# Altium project a4403-ELE-CAD.PrjPcb (part 4 of 4)

## Sheet SMPS.SchDoc
size Letter; SheetNumber: 13; SheetTotal: 15
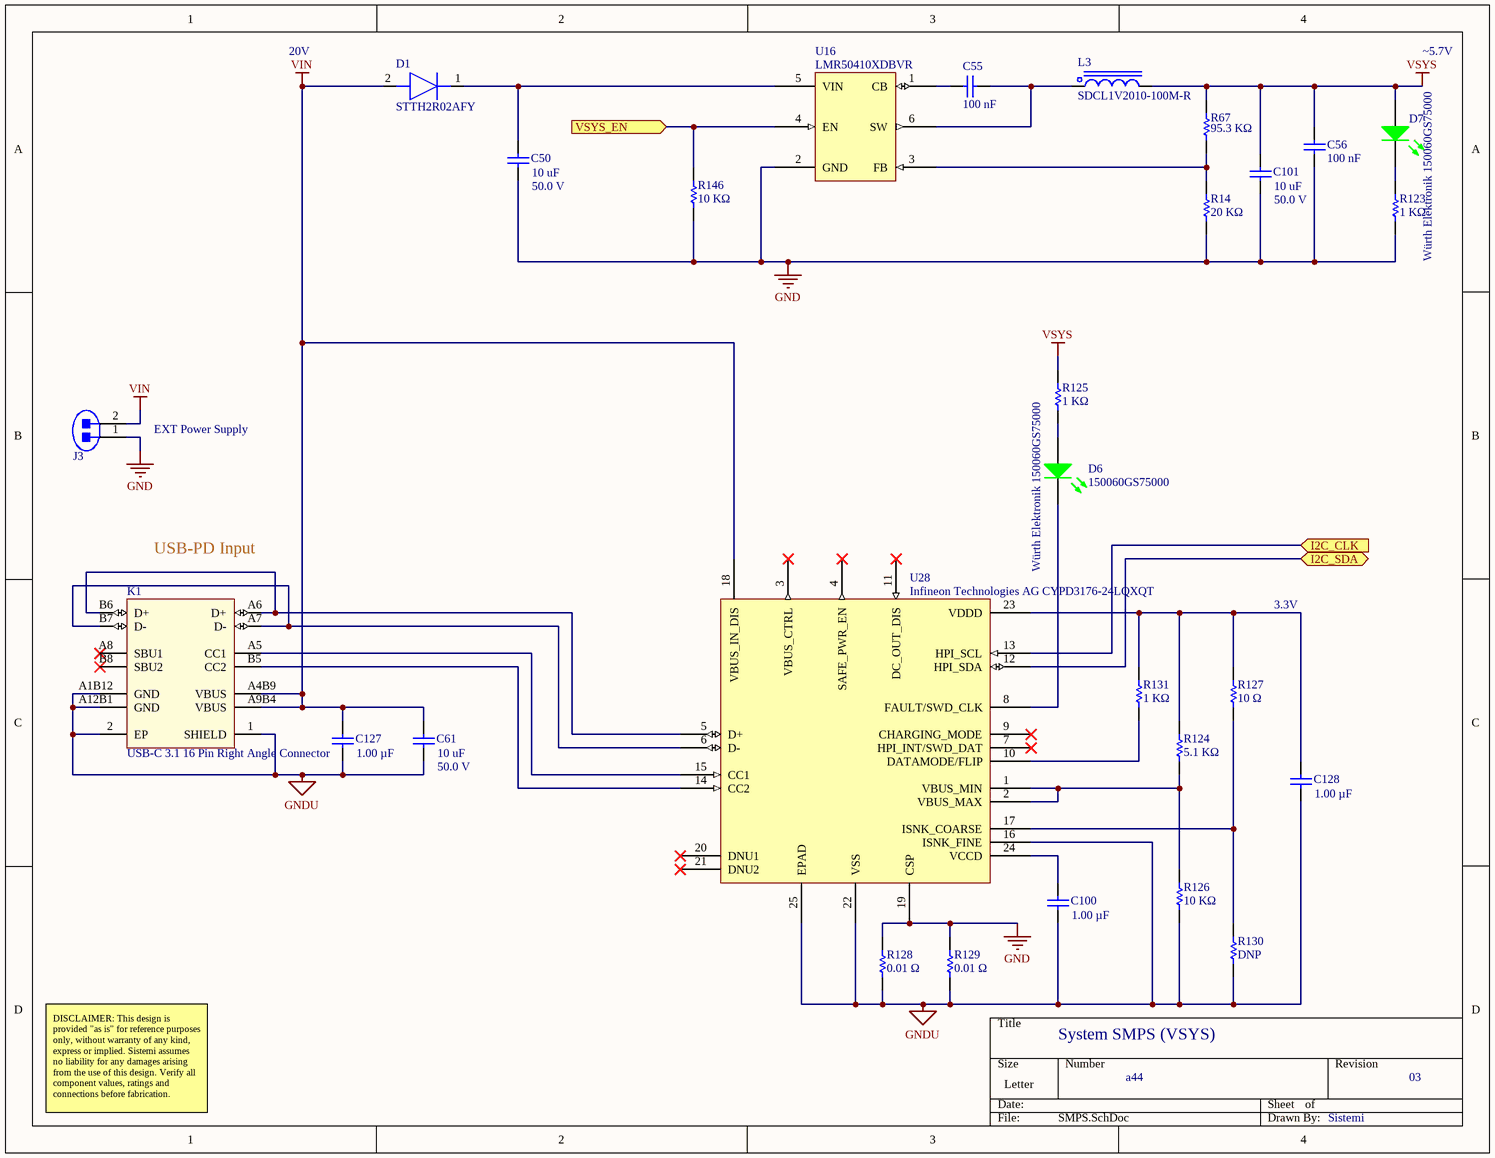
[diagram p12: SMPS.SchDoc]

### Parts
C50  Capacitance: 10 uF  Voltage Rating (DC): 50.0 V  [CAPC3216X180X55LL20T25]  (hidden comment: Murata GRM31CR61H106KA12L)
C55  Capacitance: 100 nF  [CAPC1005X56X25NL10T15]  (hidden comment: Samsung CL05B104KO5NNNC)
C56  Capacitance: 100 nF  [CAPC1005X56X25NL10T15]  (hidden comment: Samsung CL05B104KO5NNNC)
C61  Capacitance: 10 uF  Voltage Rating (DC): 50.0 V  [CAPC3216X180X55LL20T25]  (hidden comment: Murata GRM31CR61H106KA12L)
C100  Capacitance: 1.00 µF  [CAPC1608X90X35NL15T15]  (hidden comment: Samsung CL10B105KA8NNNC)
C101  Capacitance: 10 uF  Voltage Rating (DC): 50.0 V  [CAPC3216X180X55LL20T25]  (hidden comment: Murata GRM31CR61H106KA12L)
C127  Capacitance: 1.00 µF  [CAPC1608X90X35NL15T15]  (hidden comment: Samsung CL10B105KA8NNNC)
C128  Capacitance: 1.00 µF  [CAPC1608X90X35NL15T15]  (hidden comment: Samsung CL10B105KA8NNNC)
D1  STTH2R02AFY  [SODFL4724X103N]
D6  Würth Elektronik 150060GS75000  Manufacturer Part Number: 150060GS75000  [PCB-5fu3j7c0qqekthrt71i6-1]
D7  Würth Elektronik 150060GS75000  [PCB-5fu3j7c0qqekthrt71i6-1]
J3  TE Connectivity / AMP 5-146280-2  [PCB-nx47vqovjjduu8dkc1uz-1]  (value not drawn)
K1  USB-C 3.1 16 Pin Right Angle Connector  [PCB-ld6ppm2v3fcnldhcn63r-1]
L3  SDCL1V2010-100M-R  [PCB-3ir64hapazioc2jy0mm2-1]
R14  Resistance: 20 KΩ  [RESC1608X55X30ML15T15]  (hidden comment: Generic RES 0603)
R67  Resistance: 95.3 KΩ  [RESC1005X40X25NL05T05]  (hidden comment: 95.3 KΩ,±1%,0402)
R123  Resistance: 1 KΩ  [RESC1608X55X30ML15T15]  (hidden comment: Generic RES 0603)
R124  Resistance: 5.1 KΩ  [RESC1608X55X30ML15T15]  (hidden comment: Generic RES 0603)
R125  Resistance: 1 KΩ  [RESC1608X55X30ML15T15]  (hidden comment: Generic RES 0603)
R126  Resistance: 10 KΩ  [RESC1608X55X30ML15T15]  (hidden comment: Generic RES 0603)
R127  Resistance: 10 Ω  [RESC1005X40X25NL05T05]  (hidden comment: 10 Ω,±1%,0402)
R128  Resistance: 0.01 Ω  [RESC1005X40X25NL05T05]  (hidden comment: 0.01 Ω,±1%,0402)
R129  Resistance: 0.01 Ω  [RESC1005X40X25NL05T05]  (hidden comment: 0.01 Ω,±1%,0402)
R130  Resistance: DNP  [RESC1608X55X30ML15T15]  (hidden comment: Generic RES 0603)
R131  Resistance: 1 KΩ  [RESC1608X55X30ML15T15]  (hidden comment: Generic RES 0603)
R146  Resistance: 10 KΩ  [RESC1608X55X30LL15T15]  (hidden comment: Generic RES 0603)
U16  LMR50410XDBVR  [PCB-b726so6zuq7w9f75ocqz-1]
U28  Infineon Technologies AG CYPD3176-24LQXQT  [QFN-24_N]

### Ports
I2C_CLK (in), I2C_SDA (bidir), VSYS_EN (in)

### Nets
GND: C50.1 C56.2 C101.1 J3.1 R14.1 R123.1 R128.2 R129.2 R146.1 U16.2(GND) U28.19(CSP)
GNDU: C61.1 C100.1 C127.1 C128.1 K1.1(SHIELD) K1.2(EP) K1.A1B12(GND) K1.A12B1(GND) R126.1 R128.1 R129.1 R130.1 U28.16(ISNK_FINE) U28.22(VSS) U28.25(EPAD)
VIN: C61.2 C127.2 D1.2(A) J3.2 K1.A4B9(VBUS) K1.A9B4(VBUS) U28.18(VBUS_IN_DIS)
VSYS: C56.1 C101.2 D7.2(A) L3.1 R67.2 R125.2
I2C1_CLK: U28.13(HPI_SCL) ; port I2C_CLK
I2C1_SDA: U28.12(HPI_SDA) ; port I2C_SDA
NetC50_2: C50.2 D1.1(K) U16.5(VIN)
NetC55_1: C55.1 L3.2 U16.6(SW)
NetC55_2: C55.2 U16.1(CB)
NetC100_2: C100.2 U28.24(VCCD)
NetC128_2: C128.2 R124.2 R127.1 R131.2 U28.23(VDDD)
NetD6_1: D6.1(K) U28.8(FAULT/SWD_CLK)
NetD6_2: D6.2(A) R125.1
NetD7_1: D7.1(K) R123.2
NetK1_A5: K1.A5(CC1) U28.15(CC1)
NetK1_A6: K1.A6(D+) K1.B6(D+) U28.5(D+)
NetK1_A7: K1.A7(D-) K1.B7(D-) U28.6(D-)
NetK1_B5: K1.B5(CC2) U28.14(CC2)
NetR14_2: R14.2 R67.1 U16.3(FB)
NetR124_1: R124.1 R126.2 U28.1(VBUS_MIN) U28.2(VBUS_MAX)
NetR127_2: R127.2 R130.2 U28.17(ISNK_COARSE)
NetR131_1: R131.1 U28.10(DATAMODE/FLIP)
NetR146_2: R146.2 U16.4(EN) ; port VSYS_EN

Not connected (* = marked no-connect by the designer): K1 A8(SBU1)* B8(SBU2)*; U28 3(VBUS_CTRL)* 4(SAFE_PWR_EN)* 7(HPI_INT/SWD_DAT)* 9(CHARGING_MODE)* 11(DC_OUT_DIS)* 20(DNU1)* 21(DNU2)*

### Notes on the sheet
- 20V
- ~5.7V
- EXT Power Supply
- USB-PD Input
- 3.3V
- System SMPS (VSYS)
- DISCLAIMER: This design is provided "as is" for reference purposes only, without warranty of any kind, express or implied. Sistemi assumes no liability for any damages arising from the use of this design. Verify all component values, ratings and connections before fabrication.
- a44
- 03
- Sistemi

### Library data of the parts
C50 C61 C101 = CMP-3554908-2: as C115 on sheet PowerDist; Dielectric Characteristic: X5R; Lifecycle Status: Active; Mounting Style: Surface Mount; Number of Pins: 2; Octopart Url: https://octopart.com/grm31cr61h106ka12l-murata-18903335; OctopartID: fd8535afa9c42242; Packaging: Cut Tape (CT); REACH SVHC Compliance: No SVHC; RoHS: Compliant; Size-Length: 0.0032 m; Size-Thickness: 0.0016 m; Size-Width: 0.0016 m
C55 C56 = CMP-bf2276a55d9a60e5-19: as C52 on sheet JigInterface; Mounting Style: Surface Mount; Case/Package: 0402; OctopartID: 0755ced2c795d892; Footprint: PCB-0002-00476-3; Octopart URL: https://octopart.com/cl05b104ko5nnnc-samsung-9299366; RoHS: Compliant; Manufacturer Part Number: CL05B104KO5NNNC
C100 C127 C128 = CMP-7473528-5: as C51 on sheet JigInterface; RoHS: Compliant; Mounting Style: Surface Mount; Footprint: PCB-0002-00062-3; Octopart URL: http://octopart.com/cl10b105ka8nnnc-samsung-19831597; Case/Package: 0603; OctopartID: ce7a065e703111bd; Dielectric Characteristic: X7R
D1 = STTH2R02AFY: as D9 on sheet PowerDist; Datasheet Link: https://www.st.com/resource/en/datasheet/stth2r02af-y.pdf; Height: 1.03mm; Manufacturer Part Number: STTH2R02AFY; Mouser Part Number: 511-STTH2R02AFY; Mouser Price/Stock: https://www.mouser.co.uk/ProductDetail/STMicroelectronics/STTH2R02AFY?qs=pZIKbki37pqpUMRfOtxSog%3D%3D; Arrow Part Number: STTH2R02AFY; Arrow Price/Stock: https://www.arrow.com/en/products/stth2r02afy/stmicroelectronics
D6 D7 = CMP-12518857-12: as D2 on sheet JigInterface; Footprint: PCC-0029-00260-1
  D7: Manufacturer Part Number: 150060GS75000
J3 = CMP-876e4e6699ef58a9-5: as J17 on sheet PowerDist; Contact Type: Male Pin; Octopart URL: http://octopart.com/5-146280-2-te+connectivity+%2F+amp-39436426; Contact Finish: Gold; HelpURL: http://www.te.com/commerce/DocumentDelivery/DDEController?Action=srchrtrv&DocNm=146280&DocType=Customer+Drawing&DocLang=English; Cost: 0.43; Contact Mating Length: 0.230" (5.84mm); Mounting Type: Through Hole; Family: Rectangular Connectors - Headers, Male Pins; Connector Type: Header, Unshrouded, Breakaway; Category: Connectors, Interconnects; Number of Rows: 1; Pitch: Header, Unshrouded, Breakaway; Manufacturer Part Number: 5-146280-2; Contact Finish Thickness: 15µin (0.38µm); OctopartID: 3545fe16d0a9ea82
K1 = CMP-qyb7yekqcd84h33ugas0-6: Manufacturer Part Number: USB4105-GF-A-120; ReplaceComponentId: NMLHXIMK; CustomComponentID: qyb7yekqcd84h33ugas0; PartId: 1
L3 = CMP-f0983e8c5bc42f5f-1: Inductor Power Semi-Shielded 10uH 20% 100KHz Ferrite 0.5A T/R; Octopart Url: https://octopart.com/sdcl1v2010-100m-r-cooper+bussmann-119443002; Manufacturer Part Number: SDCL1V2010-100M-R; OctopartID: f0983e8c5bc42f5f
R14 = CMP-0800c38b3cf2d7c7-3: as R73 on sheet VDUT; Octopart URL: TBD; Number of Pins: 2; Mounting Style: Surface Mount; Packaging: Tape & Reel (TR); Lifecycle Status: Active; RoHS: Compliant; Case: 0603; Operating Temperature: -55.0 °C to 125 °C; REACH SVHC Compliance: No SVHC; Footprint: PCB-0002-00066-3; OctopartID: a8e96364fc37772e
R67 = CMP-3902036-3: Generic RES 0402, =Resistance+','+Tolerance+','+Case; Manufacturer Part Number: RC0402FR-0795K3L; Lead-Free Status: Lead Free; Voltage: 50.0 V; Power: 0.063 W; Mounting Style: Surface Mount; RoHS: Compliant; Number of Pins: 2; Tolerance: ±1%; Octopart Url: TBD; Case: 0402; OctopartID: 26dced8948c2f91b
R123 R125 R131 = CMP-0800c38b3cf2d7c7-3: Generic RES 0603, =Resistance+','+Tolerance+','+Case; Manufacturer Part Number: RT0603FRE071KL; Case/Package (SI): 1608; Lead-Free Status: Lead Free; Power Rating: 63.0 mW; Voltage: 50V; ELV Compliant: Compliant; Tolerance: ±1%; Temperature Coefficient: -50.0 ppm/°C to 50.0 ppm/°C; Octopart URL: TBD; Number of Pins: 2; Mounting Style: Surface Mount; Packaging: Tape & Reel (TR); Lifecycle Status: Active; RoHS: Compliant; Case: 0603; Operating Temperature: -55.0 °C to 125 °C; REACH SVHC Compliance: No SVHC; Footprint: PCB-0002-00066-3; OctopartID: a8e96364fc37772e
R124 = CMP-0800c38b3cf2d7c7-3: as R18-R20 on sheet PowerDist; Octopart URL: TBD; Number of Pins: 2; Mounting Style: Surface Mount; Packaging: Tape & Reel (TR); Lifecycle Status: Active; RoHS: Compliant; Case: 0603; Operating Temperature: -55.0 °C to 125 °C; REACH SVHC Compliance: No SVHC; Footprint: PCB-0002-00066-3; OctopartID: a8e96364fc37772e
R126 R146 = CMP-0800c38b3cf2d7c7-3: as R77 on sheet VDUT; Octopart URL: TBD; Number of Pins: 2; Mounting Style: Surface Mount; Packaging: Tape & Reel (TR); Lifecycle Status: Active; RoHS: Compliant; Case: 0603; Operating Temperature: -55.0 °C to 125 °C; REACH SVHC Compliance: No SVHC; Footprint: PCB-0002-00066-3; OctopartID: a8e96364fc37772e
R127 = CMP-3902036-3: as R61 on sheet JigInterface; Mounting Style: Surface Mount; RoHS: Compliant; Number of Pins: 2; Tolerance: ±1%; Octopart Url: TBD; Case: 0402; OctopartID: 26dced8948c2f91b
R128 R129 = CMP-3902036-3: as R69 on sheet VDUT; Mounting Style: Surface Mount; RoHS: Compliant; Number of Pins: 2; Tolerance: ±1%; Octopart Url: TBD; Case: 0402; OctopartID: 26dced8948c2f91b
R130 = CMP-0800c38b3cf2d7c7-3: Generic RES 0603, =Resistance+','+Tolerance+','+Case; Case/Package (SI): 1608; Lead-Free Status: Lead Free; Power Rating: 63.0 mW; Voltage: 50V; ELV Compliant: Compliant; Tolerance: ±1%; Temperature Coefficient: -50.0 ppm/°C to 50.0 ppm/°C; Octopart URL: TBD; Number of Pins: 2; Mounting Style: Surface Mount; Packaging: Tape & Reel (TR); Lifecycle Status: Active; RoHS: Compliant; Case: 0603; Operating Temperature: -55.0 °C to 125 °C; REACH SVHC Compliance: No SVHC; Footprint: PCB-0002-00066-3; OctopartID: a8e96364fc37772e
U16 = CMP-0f7bc0b79604d0bc-4: SIMPLE SWITCHER 4-V to 36-V, 1-A synchronous step-down converter 6-SOT-23 -40 to 150; Number of Outputs: 1; Switching Frequency: 700kHz (typ); Topology: Buck Converter; Output Current: 1.0A; Lead-Free Status: Lead Free; Input Voltage: 4.0V to 36.0V; Output Voltage: Adjustable (SW to GND: -0.3V to VIN+0.3V); case/package: SOT-23-6 DBV Package; Number of Pins: 6; Mounting Style: Surface Mount; Manufacturer Part Number: LMR50410XDBVR; Operating Temperature (Junction): -40°C to 150°C; Octopart URL: https://octopart.com/lmr50410xdbvr-texas+instruments-113687577; OctopartID: 0f7bc0b79604d0bc; Lifecycle Status: Not Listed by Manufacturer
U28 = CMP-66c0a8bd4ec7b907-1: Usb Type-C Pd Cntrl, -40 To 105Deg C Rohs Compliant: Yes; Manufacturer Part Number: CYPD3176-24LQXQT; Octopart Url: https://octopart.com/cypd3176-24lqxqt-infineon+technologies+ag-125242721; OctopartID: 66c0a8bd4ec7b907

## Sheet IOExpand.SchDoc
size Letter; SheetNumber: 14; SheetTotal: 15
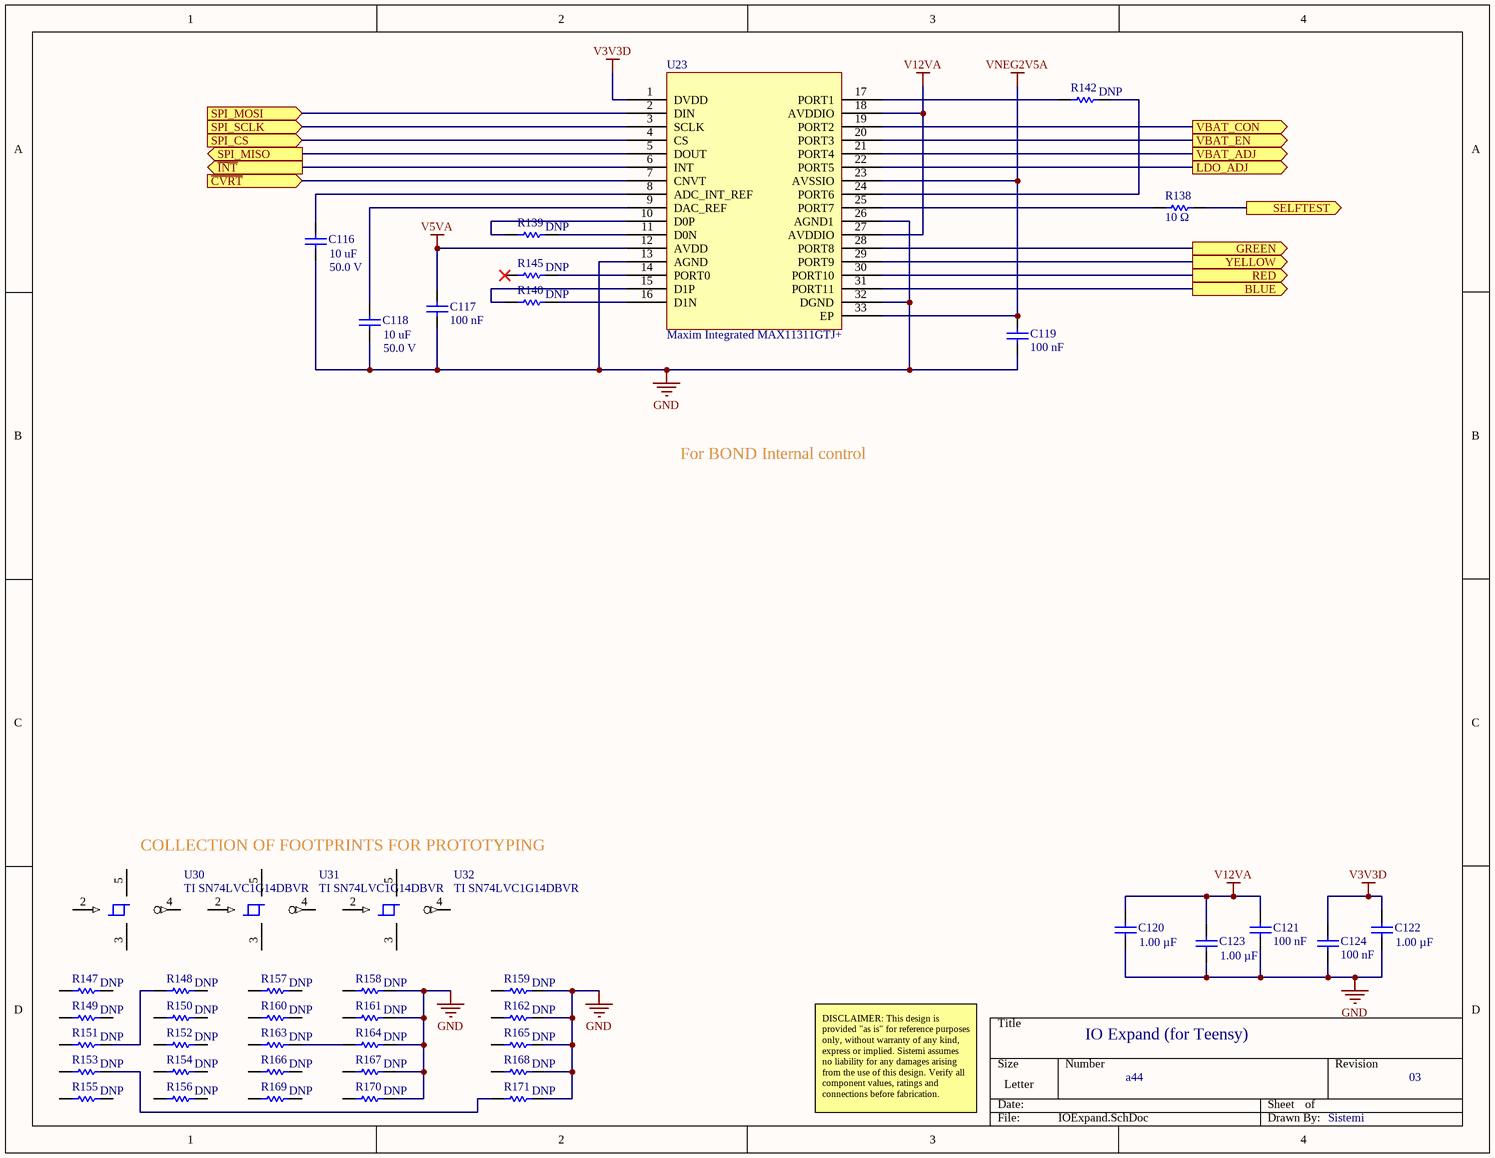
[diagram p13: IOExpand.SchDoc]

### Parts
C116  Capacitance: 10 uF  Voltage Rating (DC): 50.0 V  [CAPC3216X180X55LL20T25]  (hidden comment: Murata GRM31CR61H106KA12L)
C117  Capacitance: 100 nF  [CAPC1005X56X25NL10T15]  (hidden comment: Samsung CL05B104KO5NNNC)
C118  Capacitance: 10 uF  Voltage Rating (DC): 50.0 V  [CAPC3216X180X55LL20T25]  (hidden comment: Murata GRM31CR61H106KA12L)
C119  Capacitance: 100 nF  [CAPC1005X56X25NL10T15]  (hidden comment: Samsung CL05B104KO5NNNC)
C120  Capacitance: 1.00 µF  [CAPC1608X90X35NL15T15]  (hidden comment: Samsung CL10B105KA8NNNC)
C121  Capacitance: 100 nF  [CAPC1005X56X25NL10T15]  (hidden comment: Samsung CL05B104KO5NNNC)
C122  Capacitance: 1.00 µF  [CAPC1608X90X35NL15T15]  (hidden comment: Samsung CL10B105KA8NNNC)
C123  Capacitance: 1.00 µF  [CAPC1608X90X35NL15T15]  (hidden comment: Samsung CL10B105KA8NNNC)
C124  Capacitance: 100 nF  [CAPC1005X56X25NL10T15]  (hidden comment: Samsung CL05B104KO5NNNC)
R138  Resistance: 10 Ω  [RESC1005X40X25NL05T05]  (hidden comment: 10 Ω,±1%,0402)
R139  Resistance: DNP  [RESC1608X55X30ML15T15]  (hidden comment: Generic RES 0603)
R140  Resistance: DNP  [RESC1608X55X30ML15T15]  (hidden comment: Generic RES 0603)
R142  Resistance: DNP  [RESC1608X55X30ML15T15]  (hidden comment: Generic RES 0603)
R145  Resistance: DNP  [RESC1608X55X30ML15T15]  (hidden comment: Generic RES 0603)
R147  Resistance: DNP  [RESC1608X55X30ML15T15]  (hidden comment: Generic RES 0603)
R148  Resistance: DNP  [RESC1608X55X30ML15T15]  (hidden comment: Generic RES 0603)
R149  Resistance: DNP  [RESC1608X55X30ML15T15]  (hidden comment: Generic RES 0603)
R150  Resistance: DNP  [RESC1608X55X30ML15T15]  (hidden comment: Generic RES 0603)
R151  Resistance: DNP  [RESC1608X55X30ML15T15]  (hidden comment: Generic RES 0603)
R152  Resistance: DNP  [RESC1608X55X30ML15T15]  (hidden comment: Generic RES 0603)
R153  Resistance: DNP  [RESC1608X55X30ML15T15]  (hidden comment: Generic RES 0603)
R154  Resistance: DNP  [RESC1608X55X30ML15T15]  (hidden comment: Generic RES 0603)
R155  Resistance: DNP  [RESC1608X55X30ML15T15]  (hidden comment: Generic RES 0603)
R156  Resistance: DNP  [RESC1608X55X30ML15T15]  (hidden comment: Generic RES 0603)
R157  Resistance: DNP  [RESC1608X55X30ML15T15]  (hidden comment: Generic RES 0603)
R158  Resistance: DNP  [RESC1608X55X30ML15T15]  (hidden comment: Generic RES 0603)
R159  Resistance: DNP  [RESC1608X55X30ML15T15]  (hidden comment: Generic RES 0603)
R160  Resistance: DNP  [RESC1608X55X30ML15T15]  (hidden comment: Generic RES 0603)
R161  Resistance: DNP  [RESC1608X55X30ML15T15]  (hidden comment: Generic RES 0603)
R162  Resistance: DNP  [RESC1608X55X30ML15T15]  (hidden comment: Generic RES 0603)
R163  Resistance: DNP  [RESC1608X55X30ML15T15]  (hidden comment: Generic RES 0603)
R164  Resistance: DNP  [RESC1608X55X30ML15T15]  (hidden comment: Generic RES 0603)
R165  Resistance: DNP  [RESC1608X55X30ML15T15]  (hidden comment: Generic RES 0603)
R166  Resistance: DNP  [RESC1608X55X30ML15T15]  (hidden comment: Generic RES 0603)
R167  Resistance: DNP  [RESC1608X55X30ML15T15]  (hidden comment: Generic RES 0603)
R168  Resistance: DNP  [RESC1608X55X30ML15T15]  (hidden comment: Generic RES 0603)
R169  Resistance: DNP  [RESC1608X55X30ML15T15]  (hidden comment: Generic RES 0603)
R170  Resistance: DNP  [RESC1608X55X30ML15T15]  (hidden comment: Generic RES 0603)
R171  Resistance: DNP  [RESC1608X55X30ML15T15]  (hidden comment: Generic RES 0603)
U23  Maxim Integrated MAX11311GTJ+  [PCB-s1hzzxkmij8s4b201del-1]
U30  TI SN74LVC1G14DBVR  [TI-DBV5_M]
U31  TI SN74LVC1G14DBVR  [TI-DBV5_M]
U32  TI SN74LVC1G14DBVR  [TI-DBV5_M]

### Ports
BLUE (out), GREEN (out), LDO_ADJ (out), RED (out), SELFTEST (out), SPI_CS (in), SPI_MISO (out), SPI_MOSI (in), SPI_SCLK (in), VBAT_ADJ (out), VBAT_CON (out), VBAT_EN (out), YELLOW (out), ~{CVRT} (in), ~{INT} (out)

### Nets
GND: C116.1 C117.2 C118.1 C119.2 C120.1 C121.2 C122.1 C123.1 C124.2 R158.1 R159.1 R161.1 R162.1 R164.1 R165.1 R167.1 R168.1 R170.1 R171.1 U23.13(AGND) U23.26(AGND1) U23.32(DGND)
V3V3D: C122.2 C124.1 U23.1(DVDD)
V5VA: C117.1 U23.12(AVDD)
V12VA: C120.2 C121.1 C123.2 U23.18(AVDDIO) U23.27(AVDDIO)
VNEG2V5A: C119.1 U23.23(AVSSIO) U23.33(EP)
ADC_INT: U23.6(INT) ; port ~{INT}
SPI_CS_IOX: U23.4(CS) ; port SPI_CS
SPI_MISO: U23.5(DOUT) ; port SPI_MISO
SPI_MOSI: U23.2(DIN) ; port SPI_MOSI
SPI_SCK: U23.3(SCLK) ; port SPI_SCLK
NetC116_2: C116.2 U23.8(ADC_INT_REF)
NetC118_2: C118.2 U23.9(DAC_REF)
NetQ1_5: R138.1 ; port SELFTEST
NetR28_2: U23.20(PORT3) ; port VBAT_EN
NetR36_2: U23.21(PORT4) ; port VBAT_ADJ
NetR37_1: U23.19(PORT2) ; port VBAT_CON
NetR47_2: U23.22(PORT5) ; port LDO_ADJ
NetR61_2: U23.28(PORT8) ; port GREEN
NetR62_2: U23.29(PORT9) ; port YELLOW
NetR65_2: U23.30(PORT10) ; port RED
NetR66_2: U23.31(PORT11) ; port BLUE
NetR138_2: R138.2 U23.25(PORT7)
NetR139_1: R139.1 U23.11(D0N)
NetR139_2: R139.2 U23.10(D0P)
NetR140_1: R140.1 U23.16(D1N)
NetR140_2: R140.2 U23.15(D1P)
NetR142_1: R142.1 U23.24(PORT6)
NetR142_2: R142.2 U23.17(PORT1)
NetR145_1: R145.1 U23.14(PORT0)
NetR148_2: R148.2 R151.1
NetR153_1: R153.1 R171.2
NetR163_1: R163.1 R164.2
NetU1_9: U23.7(CNVT) ; port ~{CVRT}

Not connected (* = marked no-connect by the designer): R145 2*; R147 1 2; R148 1; R149 1 2; R150 1 2; R151 2; R152 1 2; R153 2; R154 1 2; R155 1 2; R156 1 2; R157 1 2; R158 2; R159 2; R160 1 2; R161 2; R162 2; R163 2; R165 2; R166 1 2; R167 2; R168 2; R169 1 2; R170 2; U30 2(A) 3 4(Y) 5; U31 2(A) 3 4(Y) 5; U32 2(A) 3 4(Y) 5

### Notes on the sheet
- For BOND Internal control
- COLLECTION OF FOOTPRINTS FOR PROTOTYPING
- IO Expand (for Teensy)
- DISCLAIMER: This design is provided "as is" for reference purposes only, without warranty of any kind, express or implied. Sistemi assumes no liability for any damages arising from the use of this design. Verify all component values, ratings and connections before fabrication.
- a44
- 03
- Sistemi

### Library data of the parts
C116 C118 = CMP-3554908-2: as C115 on sheet PowerDist; Dielectric Characteristic: X5R; Lifecycle Status: Active; Mounting Style: Surface Mount; Number of Pins: 2; Octopart Url: https://octopart.com/grm31cr61h106ka12l-murata-18903335; OctopartID: fd8535afa9c42242; Packaging: Cut Tape (CT); REACH SVHC Compliance: No SVHC; RoHS: Compliant; Size-Length: 0.0032 m; Size-Thickness: 0.0016 m; Size-Width: 0.0016 m
C117 C119 C121 C124 = CMP-bf2276a55d9a60e5-19: as C52 on sheet JigInterface; Mounting Style: Surface Mount; Case/Package: 0402; OctopartID: 0755ced2c795d892; Footprint: PCB-0002-00476-3; Octopart URL: https://octopart.com/cl05b104ko5nnnc-samsung-9299366; RoHS: Compliant; Manufacturer Part Number: CL05B104KO5NNNC
C120 C122 C123 = CMP-7473528-5: as C51 on sheet JigInterface; RoHS: Compliant; Mounting Style: Surface Mount; Footprint: PCB-0002-00062-3; Octopart URL: http://octopart.com/cl10b105ka8nnnc-samsung-19831597; Case/Package: 0603; OctopartID: ce7a065e703111bd; Dielectric Characteristic: X7R
R138 = CMP-3902036-3: as R61 on sheet JigInterface; Mounting Style: Surface Mount; RoHS: Compliant; Number of Pins: 2; Tolerance: ±1%; Octopart Url: TBD; Case: 0402; OctopartID: 26dced8948c2f91b
R139 R140 R142 R145 R147-R171 = CMP-0800c38b3cf2d7c7-3: Generic RES 0603, =Resistance+','+Tolerance+','+Case; Manufacturer Part Number: TBD; Case/Package (SI): 1608; Lead-Free Status: Lead Free; Power Rating: 63.0 mW; Voltage: 50V; ELV Compliant: Compliant; Tolerance: ±1%; Temperature Coefficient: -50.0 ppm/°C to 50.0 ppm/°C; Octopart URL: TBD; Number of Pins: 2; Mounting Style: Surface Mount; Packaging: Tape & Reel (TR); Lifecycle Status: Active; RoHS: Compliant; Case: 0603; Operating Temperature: -55.0 °C to 125 °C; REACH SVHC Compliance: No SVHC; Footprint: PCB-0002-00066-3; OctopartID: a8e96364fc37772e
U23 = CMP-2cd8e1e00624f31f-4: 12-channel 12-Bit ADC and 12-Bit DAC, Analog PIXI, 12-Port Programmable Mixed-Signal I/O; Channels: 12; Lead-Free Status: Lead Free; Sample Rate: 400 kHz; Range Options: 0 to 2.5V, ±5V, 0 to +10V, -10V; Supply Voltage (DC): 4.75 V (max), 5.25 V (min); Manufacturer Part Number: MAX11311GTJ+; Lifecycle Status: Not Listed by Manufacturer; Octopart URL: http://octopart.com/max11311gtj%2B-maxim+integrated-70389658; RoHS: Compliant; Number of Bits: 12; OctopartID: 2cd8e1e00624f31f; Package: TQFN-32; Resolution: 12-bit
U30-U32 = CMP-19354130-5: as U14 on sheet JigInterface; REACH SVHC Compliance: No SVHC; OctopartID: 3234fb390160edf3; RoHS: Compliant; Manufacturer Part Number: SN74LVC1G14DBVR; Footprint: PCC-0151-00548-1; Octopart Url: https://octopart.com/sn74lvc1g14dbvr-texas+instruments-464434; Number of Pins: 5; Mounting Style: Surface Mount; Number of Circuits: 1; Number of Gates: 1; Lifecycle Status: Active; Case/Package: SOT-23

## Sheet Hdr5.SchDoc
size Letter; SheetNumber: 15; SheetTotal: 15
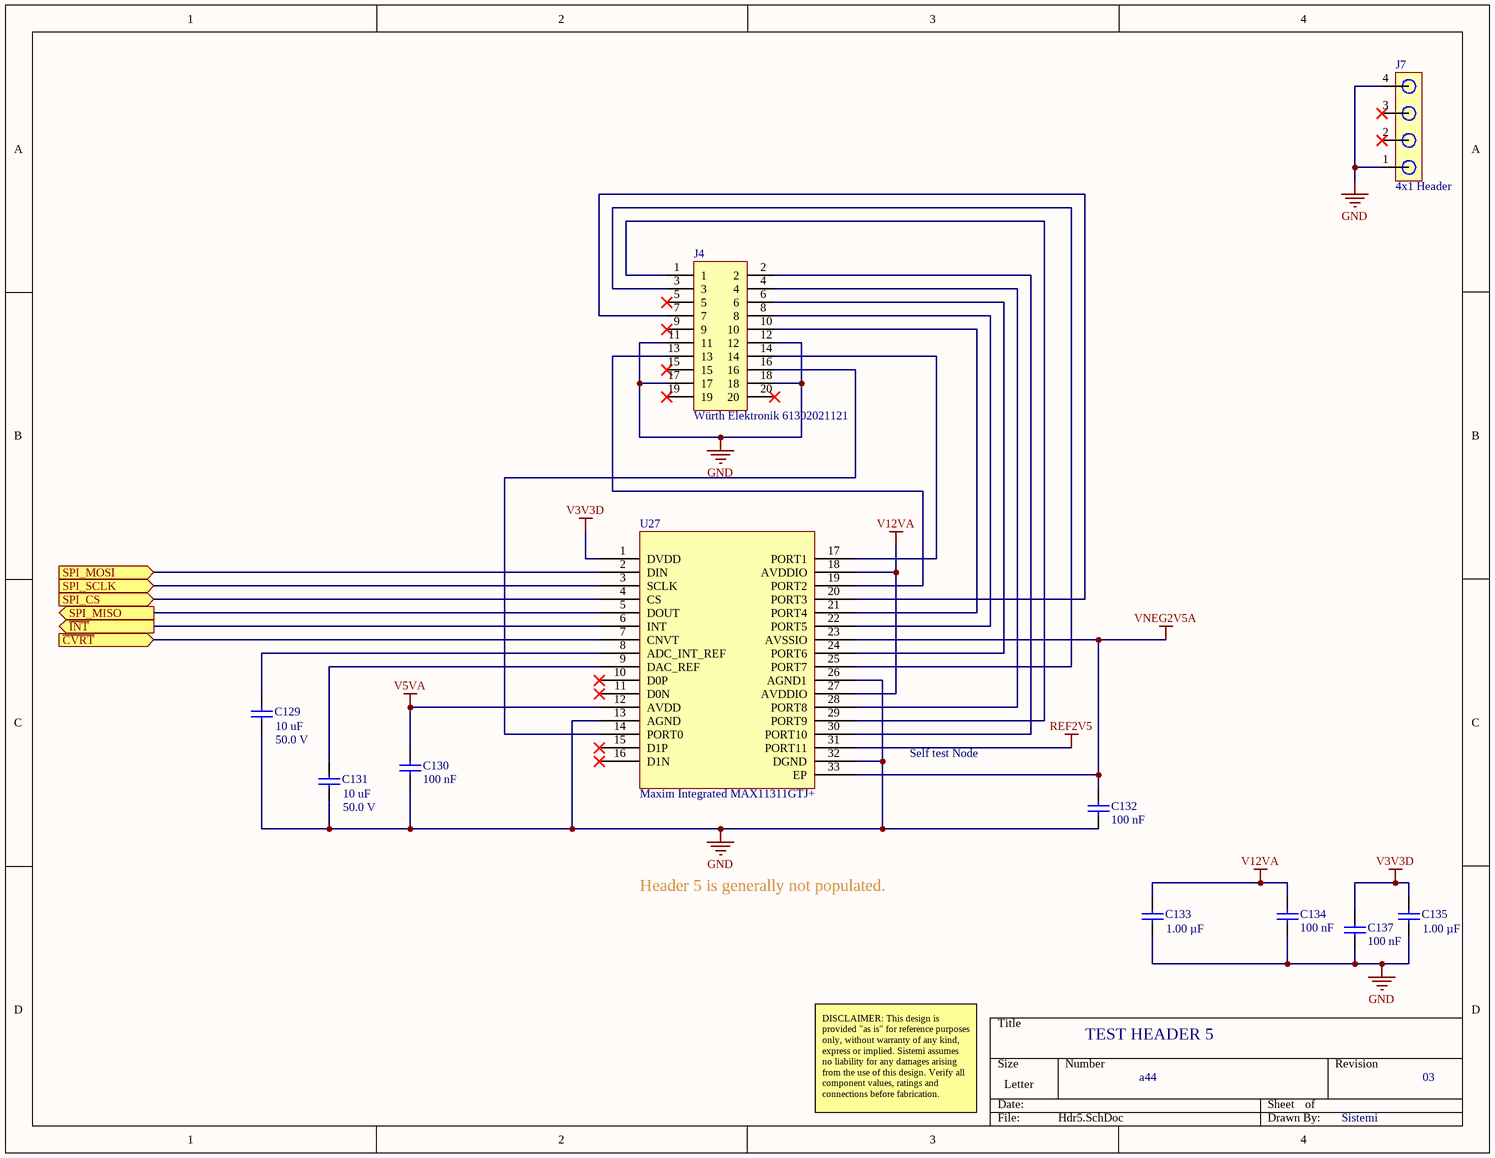
[diagram p14: Hdr5.SchDoc]

### Parts
C129  Capacitance: 10 uF  Voltage Rating (DC): 50.0 V  [CAPC3216X180X55LL20T25]  (hidden comment: Murata GRM31CR61H106KA12L)
C130  Capacitance: 100 nF  [CAPC1005X56X25NL10T15]  (hidden comment: Samsung CL05B104KO5NNNC)
C131  Capacitance: 10 uF  Voltage Rating (DC): 50.0 V  [CAPC3216X180X55LL20T25]  (hidden comment: Murata GRM31CR61H106KA12L)
C132  Capacitance: 100 nF  [CAPC1005X56X25NL10T15]  (hidden comment: Samsung CL05B104KO5NNNC)
C133  Capacitance: 1.00 µF  [CAPC1608X90X35NL15T15]  (hidden comment: Samsung CL10B105KA8NNNC)
C134  Capacitance: 100 nF  [CAPC1005X56X25NL10T15]  (hidden comment: Samsung CL05B104KO5NNNC)
C135  Capacitance: 1.00 µF  [CAPC1608X90X35NL15T15]  (hidden comment: Samsung CL10B105KA8NNNC)
C137  Capacitance: 100 nF  [CAPC1005X56X25NL10T15]  (hidden comment: Samsung CL05B104KO5NNNC)
J4  Würth Elektronik 61302021121  [PCB-nk6cd1c3p7lqby8wsdwb-1]
J7  4x1 Header  [PCB-frzzw7wnfsmgwg7mpl31-1]
U27  Maxim Integrated MAX11311GTJ+  [PCB-s1hzzxkmij8s4b201del-1]

### Ports
SPI_CS (in), SPI_MISO (out), SPI_MOSI (in), SPI_SCLK (in), ~{CVRT} (in), ~{INT} (out)

### Nets
GND: C129.1 C130.2 C131.1 C132.2 C133.1 C134.2 C135.1 C137.2 J4.11 J4.12 J4.17 J4.18 J7.1 J7.4 U27.13(AGND) U27.26(AGND1) U27.32(DGND)
REF2V5: U27.31(PORT11)
V3V3D: C135.2 C137.1 U27.1(DVDD)
V5VA: C130.1 U27.12(AVDD)
V12VA: C133.2 C134.1 U27.18(AVDDIO) U27.27(AVDDIO)
VNEG2V5A: C132.1 U27.23(AVSSIO) U27.33(EP)
ADC_INT: U27.6(INT) ; port ~{INT}
SPI_MISO: U27.5(DOUT) ; port SPI_MISO
SPI_MOSI: U27.2(DIN) ; port SPI_MOSI
SPI_SCK: U27.3(SCLK) ; port SPI_SCLK
NetC129_2: C129.2 U27.8(ADC_INT_REF)
NetC131_2: C131.2 U27.9(DAC_REF)
NetJ4_1: J4.1 U27.29(PORT9)
NetJ4_2: J4.2 U27.30(PORT10)
NetJ4_3: J4.3 U27.25(PORT7)
NetJ4_4: J4.4 U27.28(PORT8)
NetJ4_6: J4.6 U27.24(PORT6)
NetJ4_7: J4.7 U27.20(PORT3)
NetJ4_8: J4.8 U27.22(PORT5)
NetJ4_10: J4.10 U27.21(PORT4)
NetJ4_13: J4.13 U27.19(PORT2)
NetJ4_14: J4.14 U27.17(PORT1)
NetJ4_16: J4.16 U27.14(PORT0)
NetU1_9: U27.7(CNVT) ; port ~{CVRT}
NetU1_19: U27.4(CS) ; port SPI_CS

Not connected (* = marked no-connect by the designer): J4 5* 9* 15* 19* 20*; J7 2* 3*; U27 10(D0P)* 11(D0N)* 15(D1P)* 16(D1N)*

### Notes on the sheet
- Self test Node
- Header 5 is generally not populated.
- TEST HEADER 5
- DISCLAIMER: This design is provided "as is" for reference purposes only, without warranty of any kind, express or implied. Sistemi assumes no liability for any damages arising from the use of this design. Verify all component values, ratings and connections before fabrication.
- a44
- 03
- Sistemi

### Library data of the parts
C129 C131 = CMP-3554908-2: as C115 on sheet PowerDist; Dielectric Characteristic: X5R; Lifecycle Status: Active; Mounting Style: Surface Mount; Number of Pins: 2; Octopart Url: https://octopart.com/grm31cr61h106ka12l-murata-18903335; OctopartID: fd8535afa9c42242; Packaging: Cut Tape (CT); REACH SVHC Compliance: No SVHC; RoHS: Compliant; Size-Length: 0.0032 m; Size-Thickness: 0.0016 m; Size-Width: 0.0016 m
C130 C132 C134 C137 = CMP-bf2276a55d9a60e5-19: as C52 on sheet JigInterface; Mounting Style: Surface Mount; Case/Package: 0402; OctopartID: 0755ced2c795d892; Footprint: PCB-0002-00476-3; Octopart URL: https://octopart.com/cl05b104ko5nnnc-samsung-9299366; RoHS: Compliant; Manufacturer Part Number: CL05B104KO5NNNC
C133 C135 = CMP-7473528-5: as C51 on sheet JigInterface; RoHS: Compliant; Mounting Style: Surface Mount; Footprint: PCB-0002-00062-3; Octopart URL: http://octopart.com/cl10b105ka8nnnc-samsung-19831597; Case/Package: 0603; OctopartID: ce7a065e703111bd; Dielectric Characteristic: X7R
J4 = CMP-005cc8a3733edf9b-7: as J1 on sheet Teensy4; Contact Material: Copper; Footprint: PCB-005cc8a3733edf9b-1; Mounting Style: Through Hole; Color: Black; Contact Plating: Gold; REACH SVHC Compliance: No SVHC; RoHS: Compliant; Octopart URL: https://octopart.com/61302021121-w%C3%BCrth+elektronik-32855556; Packaging: Bag; Orientation: Vertical; OctopartID: 005cc8a3733edf9b; Number of Pins: 20; Operating Temperature: -40.0 °C (min); Manufacturer Part Number: 61302021121
J7 = CMP-2ffce6f22d89f03b-6: as J2 on sheet Teensy4; OctopartID: 2ffce6f22d89f03b; Pin Pitch: 2.54 mm; REACH SVHC Compliance: No SVHC; Packaging: Bulk; Color: Black; Octopart URL: https://octopart.com/tsw-102-07-g-d-samtec-272147; Contact Plating: Gold; Size-Width: 5.08 mm; Mounting Style: Through Hole; Size-Height: 2.54 mm; Housing Color: Black; Size-Length: 5.08 mm; Operating Temperature: 125 °C (max); Number of Contacts: 4; Housing Material: Plastic; RoHS: Compliant; Contact Material: Phosphor Bronze; Number of Rows: 2
U27 = CMP-2cd8e1e00624f31f-4: as U23 on sheet IOExpand; Manufacturer Part Number: MAX11311GTJ+; Lifecycle Status: Not Listed by Manufacturer; Octopart URL: http://octopart.com/max11311gtj%2B-maxim+integrated-70389658; RoHS: Compliant; Number of Bits: 12; OctopartID: 2cd8e1e00624f31f; Package: TQFN-32; Resolution: 12-bit

## Nets that join several sheets
3: VBAT (Q1.8 Q5.8), Hdr1 (Q2.8), JigInterface (Q3.8 Q4.8), VDUT (Q6.8)
6: VBAT (Q1.7 Q5.7), Hdr1 (Q2.7), JigInterface (Q3.7 Q4.7), VDUT (Q6.7)
GND: VBAT (74 pins), Hdr1 (28 pins), Hdr2 (20 pins), Hdr3 (36 pins), stlink (5 pins), Hdr4 (29 pins), JigInterface (19 pins), PowerDist (47 pins), VDUT (33 pins), Teensy4 (19 pins), SMPS (11 pins), IOExpand (22 pins), Hdr5 (17 pins)
REF2V5: Hdr1 (U11.31), Hdr2 (U19.31), Hdr3 (U20.31), Hdr4 (U21.31), PowerDist (C125.2 J17.2 U24.5 U24.6), Hdr5 (U27.31)
V3V3A: PowerDist (C3.2 C6.2 R15.2 U2.1), Teensy4 (R8.2)
V3V3D: Hdr1 (5 pins), Hdr2 (5 pins), Hdr3 (C84.2 C86.1 U20.1), Hdr4 (6 pins), JigInterface (7 pins), PowerDist (8 pins), VDUT (R80.2), Teensy4 (8 pins), IOExpand (C122.2 C124.1 U23.1), Hdr5 (C135.2 C137.1 U27.1)
V5V: JigInterface (8 pins), PowerDist (C20.2 R22.2 U5.1), Teensy4 (R7.2)
V5VA: VBAT (5 pins), Hdr1 (C37.1 U11.12), Hdr2 (C70.1 U19.12), Hdr3 (C80.1 C113.2 RL3.1 U20.12), Hdr4 (C92.1 U21.12), PowerDist (7 pins), VDUT (C49.2 U13.2 U13.6), IOExpand (C117.1 U23.12), Hdr5 (C130.1 U27.12)
V12VA: Hdr1 (5 pins), Hdr2 (5 pins), Hdr3 (5 pins), Hdr4 (5 pins), PowerDist (C4.2 C7.2 R16.2 U3.1), IOExpand (5 pins), Hdr5 (C133.2 C134.1 U27.18 U27.27)
VBAT: VBAT (R30.2 RL1.3), Hdr1 (J5.20), Hdr2 (C68.2 J9.20), Hdr4 (C89.2 J14.16 J14.18)
VDUT: Hdr1 (J5.19), Hdr2 (C67.2 J9.19), Hdr4 (C88.2 J14.17), VDUT (R84.1 RL2.3)
VIN: VBAT (D8.2), PowerDist (D9.2), VDUT (C105.2 C106.2 C107.2 U17.7), SMPS (7 pins)
VNEG2V5A: Hdr1 (C39.1 U11.23 U11.33), Hdr2 (C72.1 U19.23 U19.33), Hdr3 (C81.1 U20.23 U20.33), Hdr4 (C94.1 U21.23 U21.33), PowerDist (C18.2 R21.2 TP1.1 U7.4), Teensy4 (R89.1), IOExpand (C119.1 U23.23 U23.33), Hdr5 (C132.1 U27.23 U27.33)
VSYS: Hdr1 (C47.2 U12.6), Hdr4 (C90.2 J15.18), PowerDist (12 pins), VDUT (C114.2 U26.6), Teensy4 (R6.2), SMPS (6 pins)
ADC_INT: Hdr1 (U11.6), Hdr2 (U19.6), Hdr3 (U20.6), Hdr4 (U21.6), Teensy4 (J1.18 R3.2 U1.10), IOExpand (U23.6), Hdr5 (U27.6)
I2C1_CLK: VBAT (U9.5), VDUT (U13.5 U17.3), Teensy4 (5 pins), SMPS (U28.13)
I2C1_SDA: VBAT (U9.4), VDUT (U13.4 U17.4), Teensy4 (5 pins), SMPS (U28.12)
I2C2_SCL: Hdr2 (U18.5), Hdr4 (J14.7), JigInterface (J6.10), Teensy4 (J1.7 R5.1 U1.37)
I2C2_SDA: Hdr2 (U18.4), Hdr4 (J14.5), JigInterface (J6.12), Teensy4 (J1.5 R4.1 U1.38)
NetJ14_14: Hdr4 (J14.14), Teensy4 (U1.23)
NetJ15_15: Hdr4 (J15.15), Teensy4 (U1.41)
NetJ15_17: Hdr4 (J15.17), Teensy4 (U1.42)
NetQ1_5: VBAT (Q1.5), VDUT (Q6.2), IOExpand (R138.1)
NetR28_2: VBAT (R28.2 U8.L6 U29.5), IOExpand (U23.20)
NetR36_2: VBAT (R36.2), IOExpand (U23.21)
NetR37_1: VBAT (R37.1 R137.2), IOExpand (U23.19)
NetR47_2: Hdr1 (R47.2), IOExpand (U23.22)
NetR61_2: JigInterface (R61.2), IOExpand (U23.28)
NetR62_2: JigInterface (R62.2), IOExpand (U23.29)
NetR65_2: JigInterface (R65.2), IOExpand (U23.30)
NetR66_2: JigInterface (R66.2), IOExpand (U23.31)
NetR98_1: Hdr3 (R98.1), Teensy4 (U1.50)
NetR100_1: Hdr3 (R100.1), Teensy4 (U1.49)
NetR135_1: Top (R135.1), stlink (U25.12)
NetR136_1: Top (R136.1), stlink (U25.15)
NetR146_2: Teensy4 (U1.22), SMPS (R146.2 U16.4)
NetU1_7: JigInterface (U14.4), Teensy4 (U1.7)
NetU1_8: JigInterface (U15.4), Teensy4 (U1.8)
NetU1_9: Hdr1 (U11.7), Hdr2 (U19.7), Hdr3 (U20.7), Hdr4 (U21.7), Teensy4 (U1.9), IOExpand (U23.7), Hdr5 (U27.7)
NetU1_19: Teensy4 (U1.19), Hdr5 (U27.4)
RESET: Hdr3 (J11.7 R104.1), stlink (U25.31)
SCLK: Hdr3 (J11.5 R102.1), stlink (U25.13)
SDIO: Hdr3 (J11.3 R101.1), stlink (U25.4)
SPI_CS2_HDR4: Hdr4 (J14.15), Teensy4 (J1.16 U1.25)
SPI_CS_HDR1: Hdr1 (U11.4), Teensy4 (J1.8 U1.29)
SPI_CS_HDR2: Hdr2 (U19.4), Teensy4 (J1.10 U1.28)
SPI_CS_HDR3: Hdr3 (U20.4), Teensy4 (J1.12 U1.27)
SPI_CS_HDR4: Hdr4 (U21.4), Teensy4 (J1.14 U1.26)
SPI_CS_IOX: Teensy4 (U1.24), IOExpand (U23.4)
SPI_MISO: Hdr1 (U11.5), Hdr2 (U19.5), Hdr3 (U20.5), Hdr4 (J14.13 U21.5), Teensy4 (J1.6 U1.30), IOExpand (U23.5), Hdr5 (U27.5)
SPI_MOSI: Hdr1 (U11.2), Hdr2 (U19.2), Hdr3 (U20.2), Hdr4 (J14.9 U21.2), Teensy4 (J1.4 U1.17), IOExpand (U23.2), Hdr5 (U27.2)
SPI_SCK: Hdr1 (U11.3), Hdr2 (U19.3), Hdr3 (U20.3), Hdr4 (J14.11 U21.3), Teensy4 (J1.2 U1.18), IOExpand (U23.3), Hdr5 (U27.3)
UART_RX: Top (R135.2), Hdr1 (U10.5), Teensy4 (J1.9 U1.36)
UART_TX: Top (R136.2), Hdr1 (U10.4), Teensy4 (J1.11 U1.35)
VCC: Hdr3 (CN1.1 J11.1), stlink (U25.30)
VDUT_EN: VDUT (Q6.5 R143.2), Teensy4 (U1.12)
VDUTSMPS_EN: VDUT (R73.2 U17.1 U26.4), Teensy4 (U1.11)
VDUTSMPS_INT: VDUT (R80.1 U17.14), Teensy4 (U1.13)

## Assembly variants
SMT: not fitted C28 C31 C112 CN1 J1 J2 J3 J4 J5 J6 J7 J9 J10 J11 J12 J13 J14 J15 J16 J17 K3 R31 R42 R44 R45 R72 R74 R75 R85 R92 R94 R96 R97 R98 R99 R100 R109 R111 R112 R113 R114 R115 R116 R117 R119 R121 R122 R130 R135 R136 R139 R140 R142 R144 R145 R147 R148 R149 R150 R151 R152 R153 R154 R155 R156 R157 R158 R159 R160 R161 R162 R163 R164 R165 R166 R167 R168 R169 R170 R171 SW1 SW2 SW3 TP1 TP2 TP3 TP4 TP5 TPG1 TPG2 U1 U10 U18 U25 U27 U? U? U?